# EAGLE design pcb_kamex_fuentes_5v_7amp_1.3 (EAGLE 7.6.0)
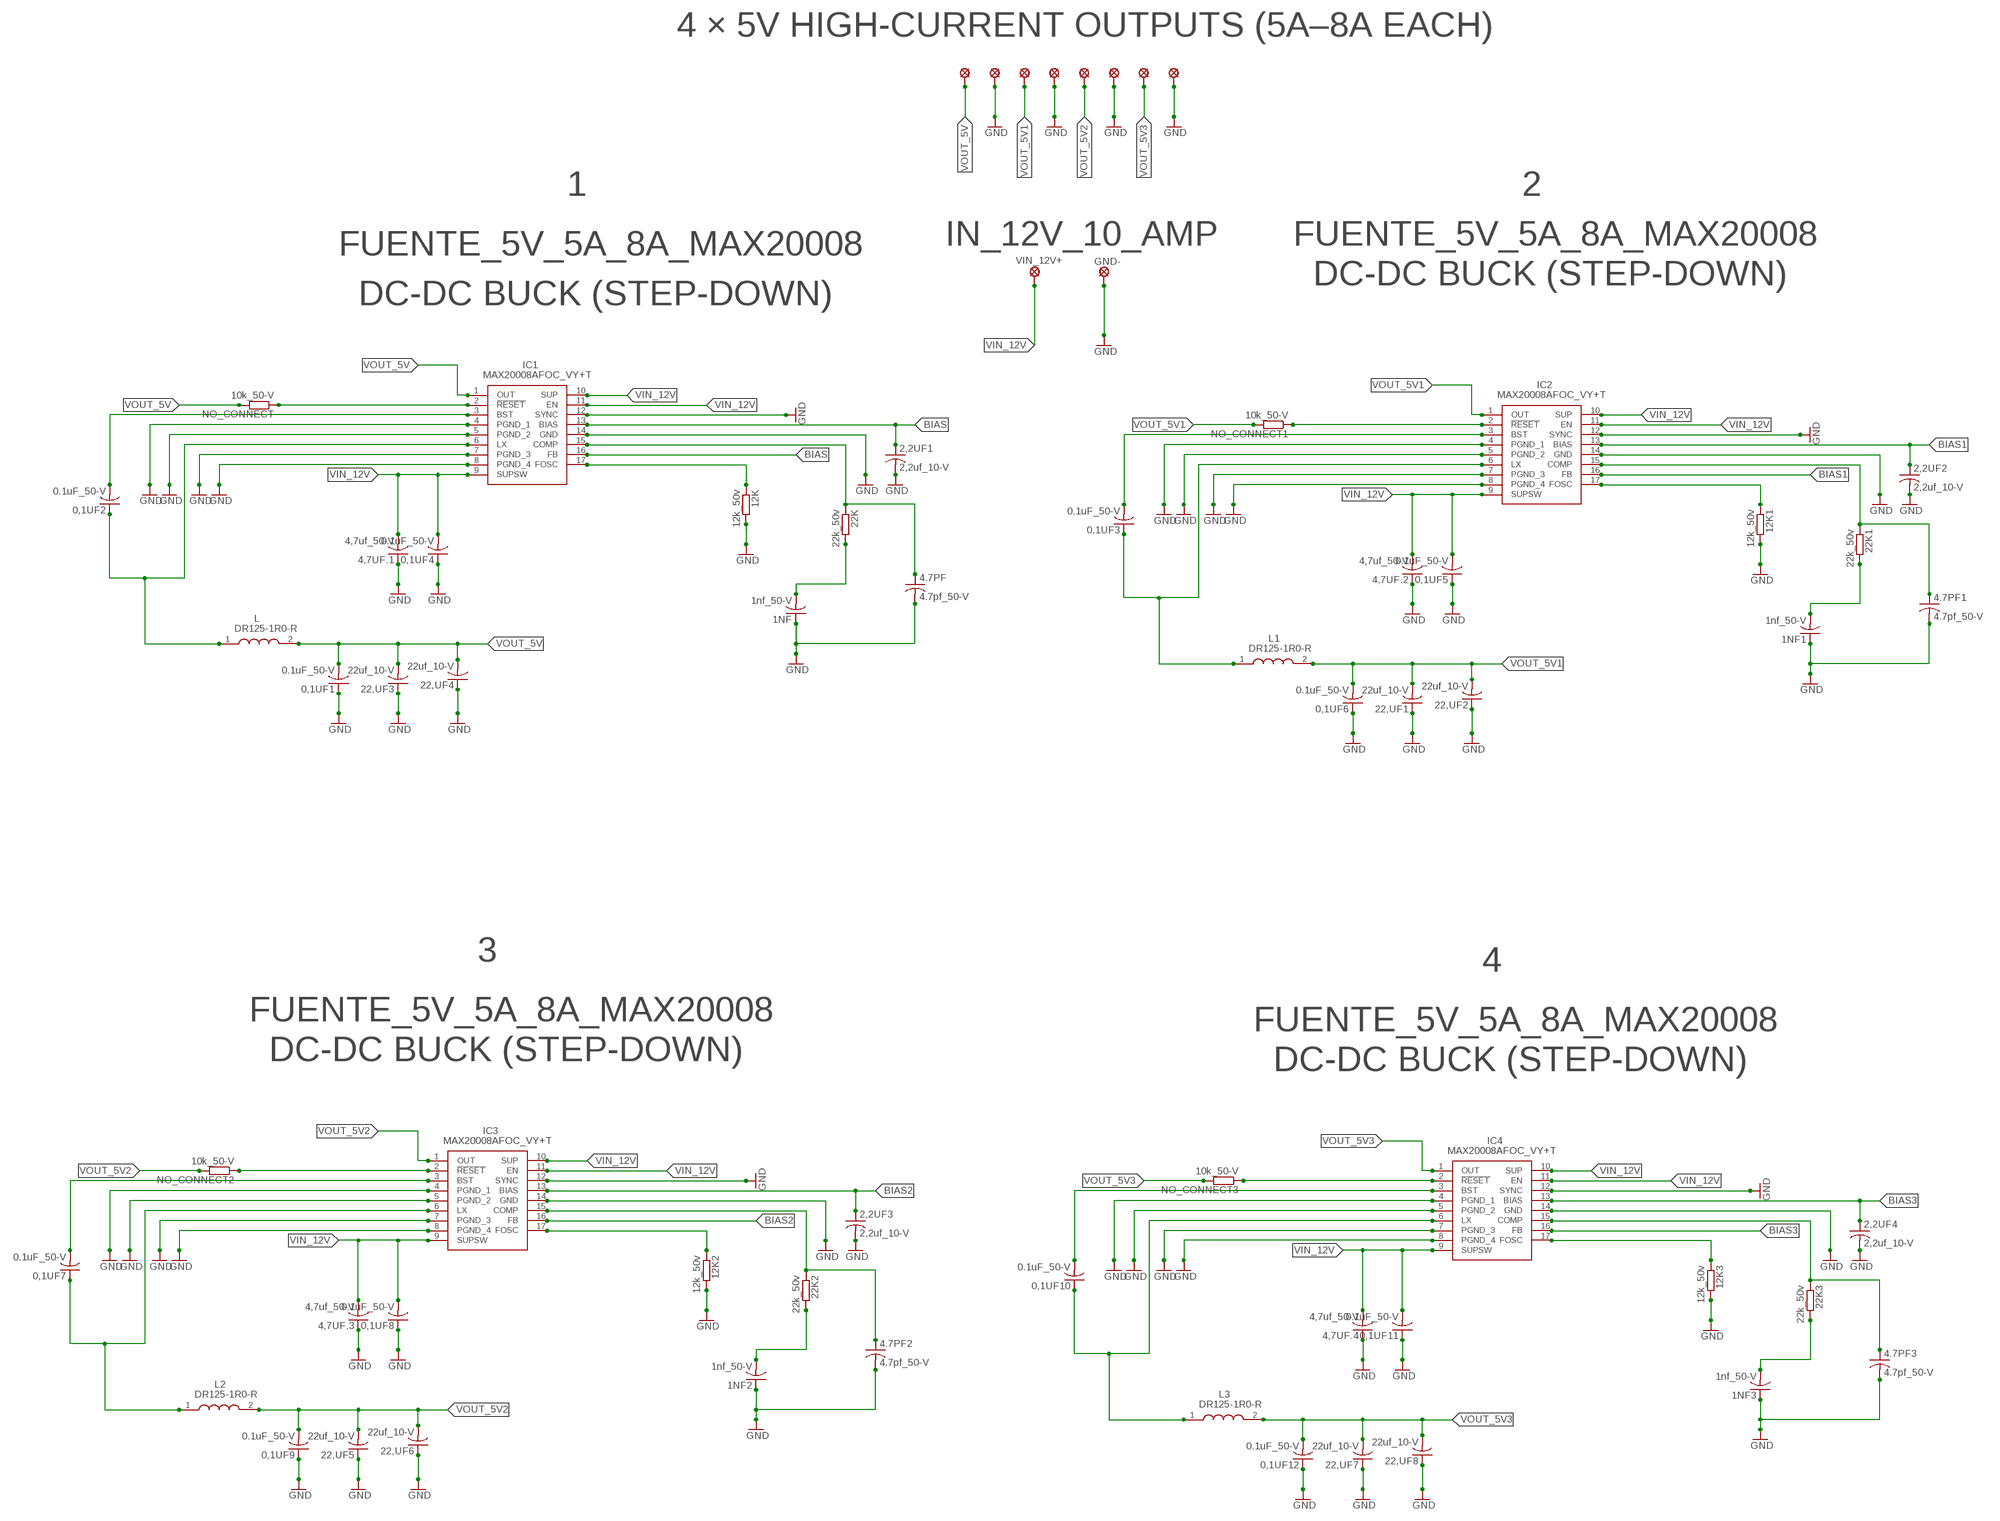
[diagram p0: schematic, sheet 1]

## Parts
0,1UF1  0.1uF_50-V  C-USC0805  [C0805]
0,1UF2  0.1uF_50-V  C-USC0805  [C0805]
0,1UF3  0.1uF_50-V  C-USC0805  [C0805]
0,1UF4  0.1uF_50-V  C-USC0805  [C0805]
0,1UF5  0.1uF_50-V  C-USC0805  [C0805]
0,1UF6  0.1uF_50-V  C-USC0805  [C0805]
0,1UF7  0.1uF_50-V  C-USC0805  [C0805]
0,1UF8  0.1uF_50-V  C-USC0805  [C0805]
0,1UF9  0.1uF_50-V  C-USC0805  [C0805]
0,1UF10  0.1uF_50-V  C-USC0805  [C0805]
0,1UF11  0.1uF_50-V  C-USC0805  [C0805]
0,1UF12  0.1uF_50-V  C-USC0805  [C0805]
1NF  1nf_50-V  C-USC0805  [C0805]
1NF1  1nf_50-V  C-USC0805  [C0805]
1NF2  1nf_50-V  C-USC0805  [C0805]
1NF3  1nf_50-V  C-USC0805  [C0805]
2,2UF1  2,2uf_10-V  C-USC0805  [C0805]
2,2UF2  2,2uf_10-V  C-USC0805  [C0805]
2,2UF3  2,2uf_10-V  C-USC0805  [C0805]
2,2UF4  2,2uf_10-V  C-USC0805  [C0805]
4,7UF.1  4,7uf_50-V  C-USC0805  [C0805]
4,7UF.2  4,7uf_50-V  C-USC0805  [C0805]
4,7UF.3  4,7uf_50-V  C-USC0805  [C0805]
4,7UF.4  4,7uf_50-V  C-USC0805  [C0805]
4.7PF  4.7pf_50-V  C-USC0805  [C0805]
4.7PF1  4.7pf_50-V  C-USC0805  [C0805]
4.7PF2  4.7pf_50-V  C-USC0805  [C0805]
4.7PF3  4.7pf_50-V  C-USC0805  [C0805]
12K  12k_50v  R-EU_M0805  [M0805]
12K1  12k_50v  R-EU_M0805  [M0805]
12K2  12k_50v  R-EU_M0805  [M0805]
12K3  12k_50v  R-EU_M0805  [M0805]
22,UF1  22uf_10-V  C-USC0805  [C0805]
22,UF2  22uf_10-V  C-USC0805  [C0805]
22,UF3  22uf_10-V  C-USC0805  [C0805]
22,UF4  22uf_10-V  C-USC0805  [C0805]
22,UF5  22uf_10-V  C-USC0805  [C0805]
22,UF6  22uf_10-V  C-USC0805  [C0805]
22,UF7  22uf_10-V  C-USC0805  [C0805]
22,UF8  22uf_10-V  C-USC0805  [C0805]
22K  22k_50v  R-EU_M0805  [M0805]
22K1  22k_50v  R-EU_M0805  [M0805]
22K2  22k_50v  R-EU_M0805  [M0805]
22K3  22k_50v  R-EU_M0805  [M0805]
GND  SE13  [SE13]
GND-  SE14  [SE14]
IC1  MAX20008AFOC_VY+T  [MAX20008AFOCVYT]
IC2  MAX20008AFOC_VY+T  [MAX20008AFOCVYT]
IC3  MAX20008AFOC_VY+T  [MAX20008AFOCVYT]
IC4  MAX20008AFOC_VY+T  [MAX20008AFOCVYT]
L  DR125-1R0-R  [INDPM125125X600N]
L1  DR125-1R0-R  [INDPM125125X600N]
L2  DR125-1R0-R  [INDPM125125X600N]
L3  DR125-1R0-R  [INDPM125125X600N]
LSP6  SE13  [SE13]
LSP7  SE13  [SE13]
LSP8  SE13  [SE13]
LSP9  SE13  [SE13]
LSP10  SE13  [SE13]
NO_CONNECT  10k_50-V  R-EU_M0805  [M0805]
NO_CONNECT1  10k_50-V  R-EU_M0805  [M0805]
NO_CONNECT2  10k_50-V  R-EU_M0805  [M0805]
NO_CONNECT3  10k_50-V  R-EU_M0805  [M0805]
VIN_12V+  SE14  [SE14]
VOUT_5V  SE13  [SE13]
VOUT_5V3  SE13  [SE13]

## Nets
BIAS: 2,2UF1.1 IC1.13(BIAS) IC1.16(FB)
BIAS1: 2,2UF2.1 IC2.13(BIAS) IC2.16(FB)
BIAS2: 2,2UF3.1 IC3.13(BIAS) IC3.16(FB)
BIAS3: 2,2UF4.1 IC4.13(BIAS) IC4.16(FB)
BST: 0,1UF2.2 IC1.3(BST)
BST1: 0,1UF3.2 IC2.3(BST)
BST2: 0,1UF7.2 IC3.3(BST)
BST3: 0,1UF10.2 IC4.3(BST)
COM: 4.7PF.1 22K.1 IC1.15(COMP)
COM1: 4.7PF1.1 22K1.1 IC2.15(COMP)
COM2: 4.7PF2.1 22K2.1 IC3.15(COMP)
COM3: 4.7PF3.1 22K3.1 IC4.15(COMP)
GND [power]: 0,1UF1.1 0,1UF4.1 0,1UF5.1 0,1UF6.1 0,1UF8.1 0,1UF9.1 0,1UF11.1 0,1UF12.1 1NF1.1 1NF2.1 1NF3.1 1NF.1 2,2UF1.2 2,2UF2.2 2,2UF3.2 2,2UF4.2 4,7UF.1.1 4,7UF.2.1 4,7UF.3.1 4,7UF.4.1 4.7PF1.2 4.7PF2.2 4.7PF3.2 4.7PF.2 12K1.2 12K2.2 12K3.2 12K.2 22,UF1.1 22,UF2.1 22,UF3.1 22,UF4.1 22,UF5.1 22,UF6.1 22,UF7.1 22,UF8.1 GND-.MP GND.MP IC1.4(PGND_1) IC1.5(PGND_2) IC1.7(PGND_3) IC1.8(PGND_4) IC1.12(SYNC) IC1.14(GND) IC2.4(PGND_1) IC2.5(PGND_2) IC2.7(PGND_3) IC2.8(PGND_4) IC2.12(SYNC) IC2.14(GND) IC3.4(PGND_1) IC3.5(PGND_2) IC3.7(PGND_3) IC3.8(PGND_4) IC3.12(SYNC) IC3.14(GND) IC4.4(PGND_1) IC4.5(PGND_2) IC4.7(PGND_3) IC4.8(PGND_4) IC4.12(SYNC) IC4.14(GND) LSP6.MP LSP8.MP LSP10.MP
N$1: 12K1.1 IC2.17(FOSC)
N$2: 1NF.2 22K.2
N$4: 0,1UF3.1 IC2.6(LX) L1.1
N$5: IC2.2(!RESET) NO_CONNECT1.1
N$6: 1NF1.2 22K1.2
N$7: 12K.1 IC1.17(FOSC)
N$9: 12K2.1 IC3.17(FOSC)
N$10: 0,1UF7.1 IC3.6(LX) L2.1
N$11: 0,1UF2.1 IC1.6(LX) L.1
N$12: IC1.2(!RESET) NO_CONNECT.1
N$13: IC3.2(!RESET) NO_CONNECT2.1
N$14: 1NF2.2 22K2.2
N$16: 12K3.1 IC4.17(FOSC)
N$17: 0,1UF10.1 IC4.6(LX) L3.1
N$18: IC4.2(!RESET) NO_CONNECT3.1
N$19: 1NF3.2 22K3.2
VIN_12V [power]: 0,1UF4.2 0,1UF5.2 0,1UF8.2 0,1UF11.2 4,7UF.1.2 4,7UF.2.2 4,7UF.3.2 4,7UF.4.2 IC1.9(SUPSW) IC1.10(SUP) IC1.11(EN) IC2.9(SUPSW) IC2.10(SUP) IC2.11(EN) IC3.9(SUPSW) IC3.10(SUP) IC3.11(EN) IC4.9(SUPSW) IC4.10(SUP) IC4.11(EN) VIN_12V+.MP
VOUT_5V: 0,1UF1.2 22,UF3.2 22,UF4.2 IC1.1(OUT) L.2 NO_CONNECT.2 VOUT_5V.MP
VOUT_5V1: 0,1UF6.2 22,UF1.2 22,UF2.2 IC2.1(OUT) L1.2 LSP7.MP NO_CONNECT1.2
VOUT_5V2: 0,1UF9.2 22,UF5.2 22,UF6.2 IC3.1(OUT) L2.2 LSP9.MP NO_CONNECT2.2
VOUT_5V3: 0,1UF12.2 22,UF7.2 22,UF8.2 IC4.1(OUT) L3.2 NO_CONNECT3.2 VOUT_5V3.MP

## Notes on the sheet
- 4 × 5V HIGH-CURRENT OUTPUTS (5A–8A EACH)
- 1 | 2
- FUENTE_5V_5A_8A_MAX20008 | IN_12V_10_AMP | FUENTE_5V_5A_8A_MAX20008
- DC-DC BUCK (STEP-DOWN)
- DC-DC BUCK (STEP-DOWN)
- 3 | 4
- FUENTE_5V_5A_8A_MAX20008 | FUENTE_5V_5A_8A_MAX20008
- DC-DC BUCK (STEP-DOWN) | DC-DC BUCK (STEP-DOWN)

## Library data of the parts
0,1UF1-0,1UF12 1NF 1NF1-1NF3 2,2UF1-2,2UF4 4,7UF.1-4,7UF.4 4.7PF 4.7PF1-4.7PF3 22,UF1-22,UF8 = rcl:C-US: CAPACITOR, American symbol
12K 12K1-12K3 22K 22K1-22K3 NO_CONNECT NO_CONNECT1-NO_CONNECT3 = rcl_dani:R-EU_: RESISTOR, European symbol
GND LSP6-LSP10 VOUT_5V VOUT_5V3 = solpad:SE13: SOLDER PAD E1542, drill 1,3mm, distributor Buerklin, 07F815
GND- VIN_12V+ = solpad:SE14: SOLDER PAD E1553, drill 1,4mm, distributor Buerklin, 07F820
IC1-IC4 = MAX20008AFOC_VY+T:MAX20008AFOC_VY+T: Switching Voltage Regulators 36V, 220kHz to 2.2MHz, 4A/6A/8A Fully integrated step down converter Source: Datasheet <https://componentsearchengine.com//MAX20008AFOC_VY T.pdf>; DESCRIPTION: Switching Voltage Regulators 36V, 220kHz to 2.2MHz, 4A/6A/8A Fully integrated step down converter; HEIGHT: 0.75mm; MANUFACTURER_NAME: Analog Devices; MANUFACTURER_PART_NUMBER: MAX20008AFOC/VY+T; MOUSER_PART_NUMBER: 700-MAX20008AFOC/VYT; MOUSER_PRICE-STOCK: https://www.mouser.co.uk/ProductDetail/Analog-Devices-Maxim-Integrated/MAX20008AFOC-VY%2bT?qs=vLWxofP3U2wvQQR8GkDmgw%3D%3D
L L1-L3 = DR125-1R0-R:DR125-1R0-R: Inductor Power Shielded Drum Core 0.894uH/1uH 20% 100KHz Ferrite 15A 0.0024Ohm DCR T/R Source: Datasheet <https://www.eaton.com/content/dam/eaton/products/electronic-components/resources/data-sheet/eaton-dr-high-power-density-high-efficiency-shielded-drum-core-power-inductors-data-sheet.pdf>; DESCRIPTION: Inductor Power Shielded Drum Core 0.894uH/1uH 20% 100KHz Ferrite 15A 0.0024Ohm DCR T/R; HEIGHT: 6mm; MANUFACTURER_NAME: Eaton; MANUFACTURER_PART_NUMBER: DR125-1R0-R

## Net classes
0 default: width 0.381 mm, drill 0.01 mm, clearance 0.254 mm
1 power: width 1.27 mm, drill 0.762 mm, clearance 0.254 mm
2 thin: width 0.254 mm, drill 0.254 mm, clearance 0.254 mm

## Board
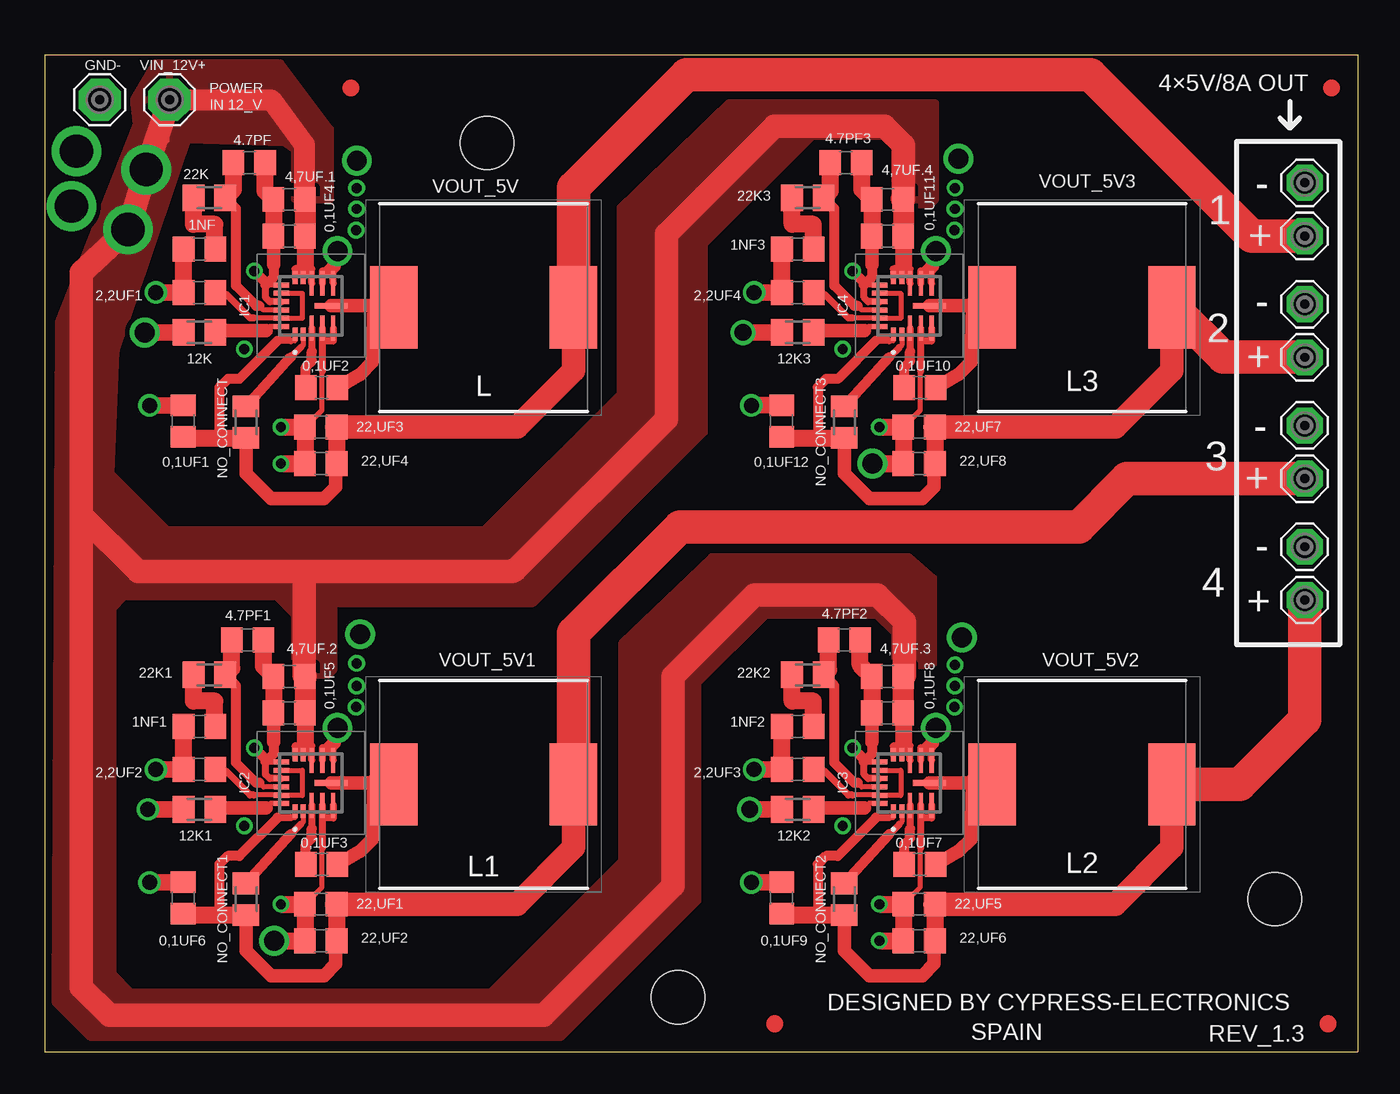
[diagram p1: board, top side]
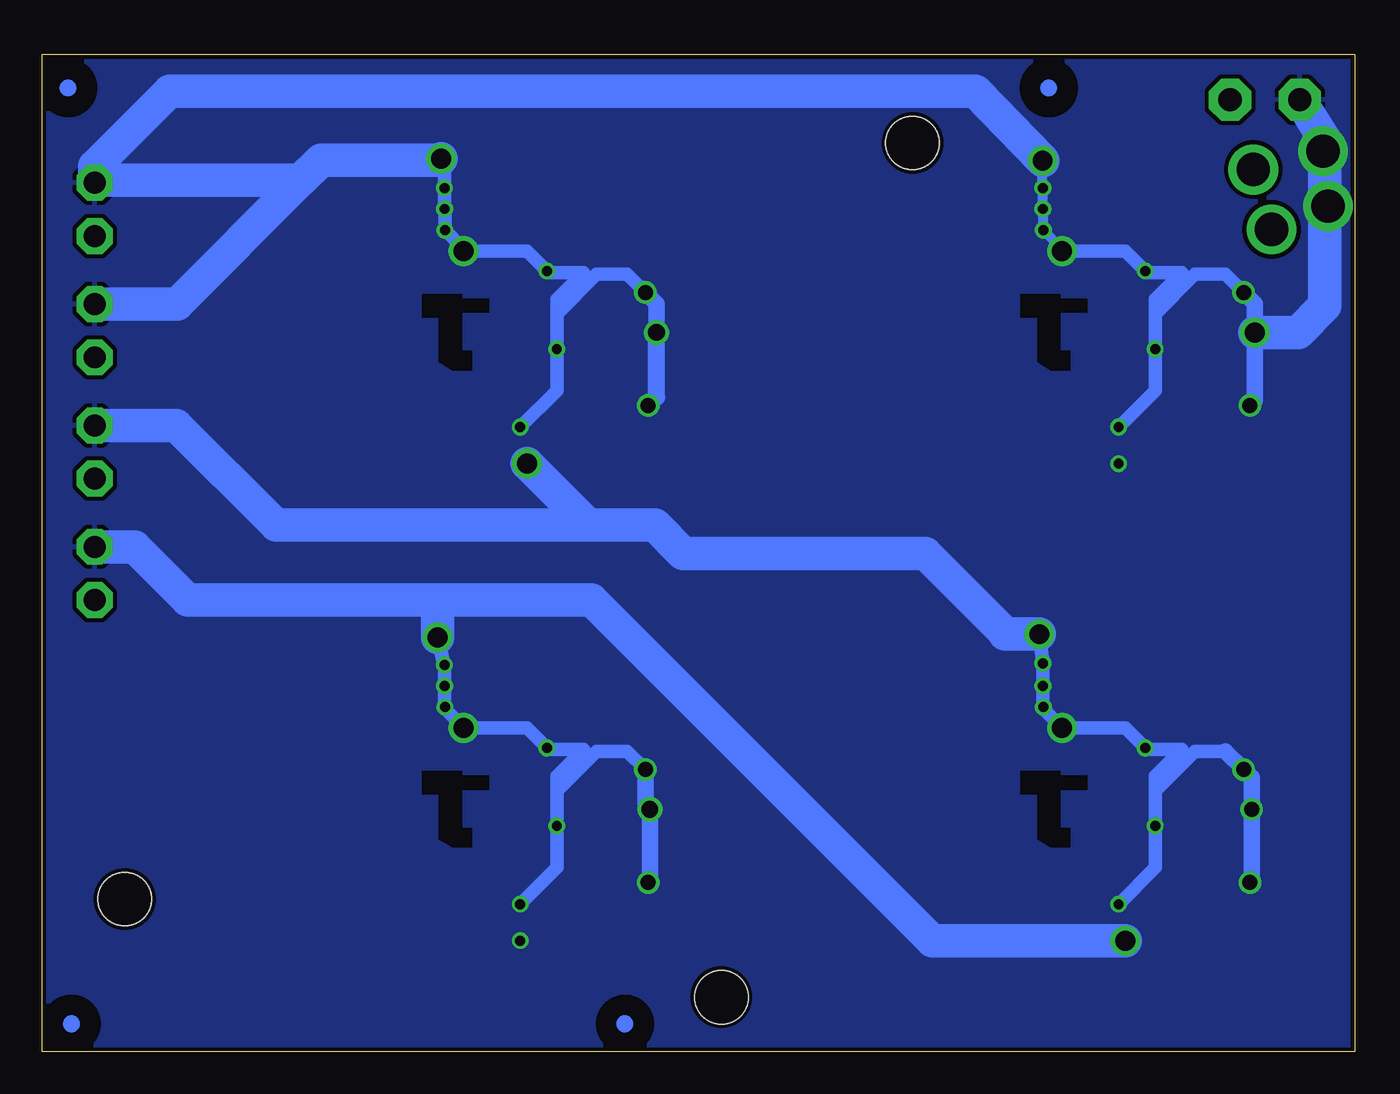
[diagram p2: board, bottom side, seen from below]

Size 79 x 60 mm. Coordinates in mm from the lower left corner, seen from the top.
Outline: 0,0 79,0 79,60 0,60 0,0
Copper layers (1*16): Top 0.035mm / dielectric 1.5mm / Bottom 0.035mm
Design rules "default *": minimum track width 10mil, minimum drill 24mil, track to track 8mil, track to pad 8mil, pad to pad 8mil, via to via 8mil, smd to smd 8mil, copper to edge 10mil, drill to drill 8mil, minimum pad ring 10mil, minimum via ring 8mil, stop-mask expansion 4mil, vias tented up to drill 0mil, thermal gap 10mil
Holes 3.2 mm at 26.6,54.7 38.1,3.3 74,9.2

### Footprints (pad centres in the part's own frame; a part is rotated, then mirrored left to right if it is on the bottom)
C0805 = smd 1.3 x 1.5: 1 -0.95,0; 2 0.95,0
M0805 = smd 1.3 x 1.6: 1 -0.95,0; 2 0.95,0
SE13 = drill 1.321 pad 2.159 octagon: MP 0,0
SE14 = drill 1.397 pad 2.54 octagon: MP 0,0
MAX20008AFOCVYT = smd 0.8 x 0.3: 1 -1.7,0.948; 2 -1.7,0.45; 10 1.7,0.45; 11 1.7,0.948 | smd 1.5 x 0.25: 3 -1.35,-0.05; 4 -1.35,-0.7; 5 -1.35,-1.35; 7 1.35,-1.35; 8 1.35,-0.7; 9 1.35,-0.05 | smd 0.35 x 2: 6 0,-1.225 | smd 0.3 x 0.925: 12 1.25,1.763; 13 0.75,1.763; 14 0.25,1.763; 15 -0.25,1.763; 16 -0.75,1.763; 17 -1.25,1.763
INDPM125125X600N = smd 2.85 x 4.95: 1 -5.4,0; 2 5.4,0

### Placement (x,y rotation side)
0,1UF1  8.33,37.97 270 top
0,1UF2  16.65,39.98 180 top
0,1UF3  16.65,11.28 180 top
0,1UF4  14.7,49.1 0 top
0,1UF5  14.7,20.4 0 top
0,1UF6  8.33,9.27 270 top
0,1UF7  52.65,11.28 180 top
0,1UF8  50.7,20.4 0 top
0,1UF9  44.33,9.27 270 top
0,1UF10  52.65,39.98 180 top
0,1UF11  50.7,49.1 0 top
0,1UF12  44.33,37.97 270 top
1NF  9.3,48.3 0 top
1NF1  9.3,19.6 0 top
1NF2  45.3,19.6 0 top
1NF3  45.3,48.3 0 top
2,2UF1  9.3,45.7 180 top
2,2UF2  9.3,17 180 top
2,2UF3  45.3,17 180 top
2,2UF4  45.3,45.7 180 top
4,7UF.1  14.7,51.3 0 top
4,7UF.2  14.7,22.6 0 top
4,7UF.3  50.7,22.6 0 top
4,7UF.4  50.7,51.3 0 top
4.7PF  12.3,53.5 0 top
4.7PF1  12.2,24.8 0 top
4.7PF2  48.1,24.8 0 top
4.7PF3  48.2,53.5 0 top
12K  9.3,43.3 180 top
12K1  9.3,14.6 180 top
12K2  45.3,14.6 180 top
12K3  45.3,43.3 180 top
22,UF1  16.6,8.9 0 top
22,UF2  16.6,6.7 0 top
22,UF3  16.6,37.6 0 top
22,UF4  16.6,35.4 0 top
22,UF5  52.6,8.9 0 top
22,UF6  52.6,6.7 0 top
22,UF7  52.6,37.6 0 top
22,UF8  52.6,35.4 0 top
22K  9.9,51.4 180 top
22K1  9.9,22.7 180 top
22K2  45.9,22.7 180 top
22K3  45.9,51.4 180 top
GND  75.8,52.3 0 top
GND-  3.3,57.3 0 top
IC1  16,44.9 90 top
IC2  16,16.2 90 top
IC3  52,16.2 90 top
IC4  52,44.9 90 top
L  26.4,44.8 0 top
L1  26.4,16.1 0 top
L2  62.4,16.1 0 top
L3  62.4,44.8 0 top
LSP6  75.8,45 0 top
LSP7  75.8,34.5 0 top
LSP8  75.8,37.7 0 top
LSP9  75.8,27.2 0 top
LSP10  75.8,30.4 0 top
NO_CONNECT  12.1,37.9 270 top
NO_CONNECT1  12.1,9.2 270 top
NO_CONNECT2  48.1,9.2 270 top
NO_CONNECT3  48.1,37.9 270 top
U$4  [CIRCLE-1MM-3R]  18.4,58 0 top
U$5  [CIRCLE-1MM-3R]  77.4,58 0 top
U$6  [CIRCLE-1MM-3R]  77.2,1.7 0 top
U$7  [CIRCLE-1MM-3R]  43.9,1.7 0 top
VIN_12V+  7.5,57.3 0 top
VOUT_5V  75.8,49.1 0 top
VOUT_5V3  75.8,41.8 0 top

### Tracks (layer width: path | path; a pad name or v marks a point on that pad's centre or on a via)
BIAS
  Top 0.305: IC1.13 15.49,45.65 15.49,44.14 IC1.16 14.23,44.16 12.59,44.16 | 2,2UF1.1 10.3,45.7
  Top 0.406: 12.59,44.16 12.34,44.16 10.9,45.6 10.35,45.6 2,2UF1.1
BIAS1
  Top 0.305: IC2.13 15.49,16.95 15.49,15.44 IC2.16 14.23,15.46 12.59,15.46 | 2,2UF2.1 10.3,17
  Top 0.406: 12.59,15.46 12.34,15.46 10.9,16.9 10.35,16.9 2,2UF2.1
BIAS2
  Top 0.305: IC3.13 51.49,16.95 51.49,15.44 IC3.16 50.23,15.46 48.59,15.46 | 2,2UF3.1 46.3,17
  Top 0.406: 48.59,15.46 48.34,15.46 46.9,16.9 46.35,16.9 2,2UF3.1
BIAS3
  Top 0.305: IC4.13 51.49,45.65 51.49,44.14 IC4.16 50.23,44.16 48.59,44.16 | 2,2UF4.1 46.3,45.7
  Top 0.406: 48.59,44.16 48.34,44.16 46.9,45.6 46.35,45.6 2,2UF4.1
BST
  Top 0.406: IC1.3 16.05,42.15
  Top 0.61: 0,1UF2.2 15.7,41.2 16,41.5 16,41.52 16.06,41.58 16.06,42.14 16.05,42.15
BST1
  Top 0.406: IC2.3 16.05,13.45
  Top 0.61: 0,1UF3.2 15.7,12.5 16,12.8 16,12.82 16.06,12.88 16.06,13.44 16.05,13.45
BST2
  Top 0.406: IC3.3 52.05,13.45
  Top 0.61: 0,1UF7.2 51.7,12.5 52,12.8 52,12.82 52.06,12.88 52.06,13.44 52.05,13.45
BST3
  Top 0.406: IC4.3 52.05,42.15
  Top 0.61: 0,1UF10.2 51.7,41.2 52,41.5 52,41.52 52.06,41.58 52.06,42.14 52.05,42.15
COM
  Top 0.305: IC1.15 13.15,44.65 12.9,44.9
  Top 0.61: 12.9,44.9 12.7,44.9 11.5,46.1 11.5,50.75 22K.1
  Top 1.016: 22K.1 11.35,51.9 4.7PF.1
COM1
  Top 0.305: IC2.15 13.15,15.95 12.9,16.2
  Top 0.61: 12.9,16.2 12.7,16.2 11.5,17.4 11.5,22.05 22K1.1
  Top 1.016: 22K1.1 11.25,23.1 4.7PF1.1
COM2
  Top 0.305: IC3.15 49.15,15.95 48.9,16.2
  Top 0.61: 48.9,16.2 48.7,16.2 47.5,17.4 47.5,22.05 22K2.1
  Top 1.016: 22K2.1 47.15,23 4.7PF2.1
COM3
  Top 0.305: IC4.15 49.15,44.65 48.9,44.9
  Top 0.61: 48.9,44.9 48.7,44.9 47.5,46.1 47.5,50.75 22K3.1
  Top 1.016: 22K3.1 47.25,51.8 4.7PF3.1
GND  (via drill 0.6, 0.9, 1, 1.2, 2)
  Top 0.305: 16.7,40.96 16.66,40.92 16.66,38.61 22,UF3.1 | IC1.12 14.23,46.16 13.28,46.16 13.27,46.17 | 16.7,12.26 16.66,12.22 16.66,9.91 22,UF1.1 | IC2.12 14.23,17.46 13.28,17.46 13.27,17.47 | 52.7,12.26 52.66,12.22 52.66,9.91 22,UF5.1 | IC3.12 50.23,17.46 49.28,17.46 49.27,17.47 | 52.7,40.96 52.66,40.92 52.66,38.61 22,UF7.1 | IC4.12 50.23,46.16 49.28,46.16 49.27,46.17
  Top 0.406: IC1.7 17.35,47 | 17.35,47 17.1,47 16.7,47 IC1.8 | IC1.5 17.35,42.78 17.36,42.78 17.36,42.79 16.7,42.79 | 16.7,42.79 IC1.4 | 17.35,47 17.4,47 | IC1.14 13.53,45.15 13.28,45.4 13.28,46.16 | 16.7,40.96 16.7,42.79 | IC2.7 17.35,18.3 | 17.35,18.3 17.1,18.3 16.7,18.3 IC2.8 | IC2.5 17.35,14.08 17.36,14.08 17.36,14.09 16.7,14.09 | 16.7,14.09 IC2.4 | 17.35,18.3 17.4,18.3 | IC2.14 13.53,16.45 13.28,16.7 13.28,17.46 | 16.7,12.26 16.7,14.09 | IC3.7 53.35,18.3 | 53.35,18.3 53.1,18.3 52.7,18.3 IC3.8 | IC3.5 53.35,14.08 53.36,14.08 53.36,14.09 52.7,14.09 | 52.7,14.09 IC3.4 | 53.35,18.3 53.4,18.3 | IC3.14 49.53,16.45 49.28,16.7 49.28,17.46 | 52.7,12.26 52.7,14.09 | IC4.7 53.35,47 | 53.35,47 53.1,47 52.7,47 IC4.8 | IC4.5 53.35,42.78 53.36,42.78 53.36,42.79 52.7,42.79 | 52.7,42.79 IC4.4 | 53.35,47 53.4,47 | IC4.14 49.53,45.15 49.28,45.4 49.28,46.16 | 52.7,40.96 52.7,42.79
  Top 0.61: 13.75,47.37 13.75,46.63 13.28,46.16 | 13.27,46.17 13.27,46.33 v12.6,47 | 13.75,18.67 13.75,17.93 13.28,17.46 | 13.27,17.47 13.27,17.63 v12.6,18.3 | 49.75,18.67 49.75,17.93 49.28,17.46 | 49.27,17.47 49.27,17.63 v48.6,18.3 | 49.75,47.37 49.75,46.63 49.28,46.16 | 49.27,46.17 49.27,46.33 v48.6,47
  Top 0.813: 0,1UF4.1 13.75,47.37 | 17.1,47 17.4,47.3 17.4,48 v17.6,48.2 | 0,1UF5.1 13.75,18.67 | 17.1,18.3 17.4,18.6 17.4,19.3 v17.6,19.5 | 0,1UF8.1 49.75,18.67 | 53.1,18.3 53.4,18.6 53.4,19.3 v53.6,19.5 | 0,1UF11.1 49.75,47.37 | 53.1,47 53.4,47.3 53.4,48 v53.6,48.2
  Top 1: v42.5,10.2 44.31,10.2 0,1UF9.1 | 12K2.2 v42.4,14.6 | 2,2UF3.2 v42.67,17 | 0,1UF12.1 42.52,38.92 v42.5,38.9 | 12K3.2 v42,43.3 | 2,2UF4.2 v42.67,45.7 | 0,1UF1.1 8.31,38.9 v6.3,38.9 | 12K.2 v6,43.3 | 2,2UF1.2 v6.67,45.7 | 0,1UF6.1 8.31,10.2 v6.3,10.2 | 12K1.2 v6.2,14.6 | 2,2UF2.2 v6.67,17
  Top 1.016: 0,1UF4.1 4,7UF.1.1 13.25,51.8 4.7PF.2 | 2,2UF1.2 1NF.1 | v14.2,37.6 22,UF3.1 22,UF4.1 v14.2,35.4 | 8.35,38.94 0,1UF1.1 | 0,1UF5.1 4,7UF.2.1 13.15,23.2 4.7PF1.2 | 2,2UF2.2 1NF1.1 | v14.2,8.9 22,UF1.1 22,UF2.1 v13.8,6.7 | 8.35,10.24 0,1UF6.1 | 0,1UF8.1 4,7UF.3.1 49.05,23.3 4.7PF2.2 | 2,2UF3.2 1NF2.1 | v50.2,8.9 22,UF5.1 22,UF6.1 v50.2,6.7 | 44.35,10.24 0,1UF9.1 | 0,1UF11.1 4,7UF.4.1 49.15,51.9 4.7PF3.2 | 2,2UF4.2 1NF3.1 | v50.2,37.6 22,UF7.1 22,UF8.1 v49.8,35.4 | 44.35,38.94 0,1UF12.1
  Bottom 0.61: v18.77,53.64 18.8,53.21 18.8,51.9 18.76,51.94 v18.76,51.99 v18.75,51.98 v18.75,50.73 18.73,50.71 v18.73,49.45 17.6,48.32 v17.6,48.2
  Bottom 0.813: v17.6,48.2 13.8,48.2 v12.6,47 12.5,46.9 10.4,46.9 12,45.3 12,44.4 | 12,44.4 v12,42.3 12,39.8 v14.2,37.6 | 12,44.4 9.6,46.8 7.77,46.8 v6.67,45.7 | 12,15.7 v12,13.6 12,11.1 v14.2,8.9 | 12,15.7 9.6,18.1 7.77,18.1 | 12,15.7 12,16.6 10.4,18.2 12.5,18.2 v12.6,18.3 13.8,19.5 v17.6,19.5 18.73,20.63 v18.73,20.75 18.75,20.77 v18.75,22.03 v18.76,22.04 v18.76,23.39 v18.77,23.4 v18.97,25.14 | 48,15.7 v48,13.6 48,11.1 v50.2,8.9 | 48,15.7 45.6,18.1 43.77,18.1 v42.67,17 | 48,15.7 48,16.6 46.4,18.2 48.5,18.2 v48.6,18.3 49.8,19.5 v53.6,19.5 54.73,20.63 v54.73,20.75 54.76,20.78 v54.76,22.04 | 48,44.4 v48,42.3 48,39.8 v50.2,37.6 | 48,44.4 45.6,46.8 43.77,46.8 v42.67,45.7 | 48,44.4 48,45.3 46.4,46.9 48.5,46.9 v48.6,47 49.8,48.2 v53.6,48.2 53.6,48.32 v54.73,49.45 54.73,50.71 v54.75,50.73 v54.75,51.98 v54.76,51.99 54.76,53.53 v54.97,53.74 | v54.76,22.04 v54.76,23.29 v54.77,23.3 v55.17,24.94 | v54.76,22.04 v54.75,22.03
  Bottom 1: v42.5,10.2 42.4,10.3 v42.4,14.6 42.67,14.87 v42.67,17 | v42,43.3 42,45.03 v42.67,45.7 | v6.67,45.7 6,45.03 v6,43.3 6,39.2 v6.3,38.9 | v6.3,10.2 6.2,10.3 v6.2,14.6 6.2,16.53 v6.67,17 7.77,18.1
  Bottom 1.016: v42.5,38.9 42,39.4 v42,43.3
  Bottom 1.422: 66.1,52.3 65.95,52.45
  Bottom 2: GND-.MP 1.8,54.9 1.8,44.9 3.4,43.3 v6,43.3 | v18.77,53.64 22.83,57.8 71.3,57.8 75.8,53.3 GND.MP arc90 75.65,52.45 65.95,52.45 63.4,52.45 | LSP6.MP 70.85,45 63.4,52.45 | 63.4,52.45 62.18,53.67 55.04,53.67 v54.97,53.74 | v55.17,24.94 55.17,27.17 | 55.17,27.17 55.2,27.2 70.2,27.2 73.4,30.4 LSP10.MP | v13.8,6.7 25.4,6.7 45.9,27.2 55.14,27.2 55.17,27.17 | v18.97,25.14 21.04,25.14 21.04,25.21 25.83,30 40.4,30 42.1,31.7 46.1,31.7 | 46.1,31.7 64.9,31.7 70.9,37.7 LSP8.MP | 46.1,31.7 v49.8,35.4
  other vias: 1.9,54.2 1.6,50.9
  cutout Bottom: 20.1,45.6 17.69,45.6 17.69,45.34 16.09,45.34 16.09,44.48 17.7,44.48 17.7,42.2 17.1,42.2 17.1,41 18.3,41 18.6,41.2 18.69,41.25 18.76,41.29 19.1,41.5 19.1,44.2 20.1,44.2
  cutout Bottom: 20.1,16.9 17.69,16.9 17.69,16.64 16.09,16.64 16.09,15.78 17.7,15.78 17.7,13.5 17.1,13.5 17.1,12.3 18.3,12.3 18.6,12.5 18.69,12.55 18.76,12.59 19.1,12.8 19.1,15.5 20.1,15.5
  cutout Bottom: 56.1,16.9 53.69,16.9 53.69,16.64 52.09,16.64 52.09,15.78 53.7,15.78 53.7,13.5 53.1,13.5 53.1,12.3 54.3,12.3 54.6,12.5 54.69,12.55 54.76,12.59 55.1,12.8 55.1,15.5 56.1,15.5
  cutout Bottom: 56.1,45.6 53.69,45.6 53.69,45.34 52.09,45.34 52.09,44.48 53.7,44.48 53.7,42.2 53.1,42.2 53.1,41 54.3,41 54.6,41.2 54.69,41.25 54.76,41.29 55.1,41.5 55.1,44.2 56.1,44.2
  pour Bottom (isolate 0.254): -1,61.8 81,61.8 81,-1.7 -1,-1.7
N$1
  Top 0.305: 10.6,14.95 12K1.1 | IC2.17 13.55,14.95 13.3,14.7
  Top 0.813: 13.3,14.7 10.35,14.7 12K1.1
N$2
  Top 1.016: 1NF.2 10.23,48.3 10.23,49.81 8.95,49.81 22K.2
N$3
  cutout Top (isolate 0.2, rank 2): 16.09,45.34 16.09,44.48 17.7,44.48 17.7,42.2 17.1,42.2 17.1,41 18.3,41 19.1,41.5 19.1,44.2 19.4,44.2 19.4,42.1 22.7,42.1 22.7,47.5 19.4,47.5 19.4,45.6 17.68,45.6 17.68,45.34
N$4
  Top 0.813: IC2.6 19.8,16.2 19.7,12.8 19,12.1 0,1UF3.1
  Top 1.016: 19.8,16.2 20.9,16.2 L1.1
N$5
  Top 0.305: 12.52,10.57 NO_CONNECT1.1 | IC2.2 15.55,13.85 15.4,13.7
  Top 0.406: 15.4,13.7 14.8,13.1
  Top 0.61: 14.8,13.1 NO_CONNECT1.1
N$6
  Top 1.016: 1NF1.2 10.23,19.6 10.23,21.11 8.95,21.11 22K1.2
N$7
  Top 0.305: 10.6,43.65 12K.1 | IC1.17 13.55,43.65 13.3,43.4
  Top 0.813: 13.3,43.4 10.35,43.4 12K.1
N$8
  cutout Top (isolate 0.2, rank 2): 16.09,16.64 16.09,15.78 17.7,15.78 17.7,13.5 17.1,13.5 17.1,12.3 18.3,12.3 19.1,12.8 19.1,15.5 19.4,15.5 19.4,13.4 22.7,13.4 22.7,18.8 19.4,18.8 19.4,16.9 17.68,16.9 17.68,16.64
N$9
  Top 0.305: 46.6,14.95 12K2.1 | IC3.17 49.55,14.95 49.3,14.7
  Top 0.813: 49.3,14.7 46.35,14.7 12K2.1
N$10
  Top 0.813: IC3.6 55.8,16.2 55.7,12.8 55,12.1 0,1UF7.1
  Top 1.016: 55.8,16.2 56.9,16.2 L2.1
N$11
  Top 0.813: IC1.6 19.8,44.9 19.7,41.5 19,40.8 0,1UF2.1
  Top 1.016: 19.8,44.9 20.9,44.9 L.1
N$12
  Top 0.305: 12.52,39.27 NO_CONNECT.1 | IC1.2 15.55,42.55 15.4,42.4
  Top 0.406: 15.4,42.4 14.8,41.8
  Top 0.61: 14.8,41.8 NO_CONNECT.1
N$13
  Top 0.305: 48.52,10.57 NO_CONNECT2.1 | IC3.2 51.55,13.85 51.4,13.7
  Top 0.406: 51.4,13.7 50.8,13.1
  Top 0.61: 50.8,13.1 NO_CONNECT2.1
N$14
  Top 1.016: 1NF2.2 46.23,19.6 46.23,21.11 44.95,21.11 22K2.2
N$15
  cutout Top (isolate 0.2, rank 2): 52.09,16.64 52.09,15.78 53.7,15.78 53.7,13.5 53.1,13.5 53.1,12.3 54.3,12.3 55.1,12.8 55.1,15.5 55.4,15.5 55.4,13.4 58.7,13.4 58.7,18.8 55.4,18.8 55.4,16.9 53.68,16.9 53.68,16.64
N$16
  Top 0.305: 46.6,43.65 12K3.1 | IC4.17 49.55,43.65 49.3,43.4
  Top 0.813: 49.3,43.4 46.35,43.4 12K3.1
N$17
  Top 0.813: IC4.6 55.8,44.9 55.7,41.5 55,40.8 0,1UF10.1
  Top 1.016: 55.8,44.9 56.9,44.9 L3.1
N$18
  Top 0.305: 48.52,39.27 NO_CONNECT3.1 | IC4.2 51.55,42.55 51.4,42.4
  Top 0.406: 51.4,42.4 50.8,41.8
  Top 0.61: 50.8,41.8 NO_CONNECT3.1
N$19
  Top 1.016: 1NF3.2 46.23,48.3 46.23,49.81 44.95,49.81 22K3.2
N$20
  cutout Top (isolate 0.2, rank 2): 52.09,45.34 52.09,44.48 53.7,44.48 53.7,42.2 53.1,42.2 53.1,41 54.3,41 55.1,41.5 55.1,44.2 55.4,44.2 55.4,42.1 58.7,42.1 58.7,47.5 55.4,47.5 55.4,45.6 53.68,45.6 53.68,45.34
VIN_12V  (via drill 2)
  Top 0.2: VIN_12V+.MP 7.4,54.8
  Top 0.406: IC1.9 16.05,47.13 15.6,47.13 15.5,47.13 | 15.5,47.13 15.07,47.13 15.05,47.11 IC1.11 | IC1.10 15.55,47.08 15.5,47.13 | IC2.9 16.05,18.43 15.6,18.43 15.5,18.43 | 15.5,18.43 15.07,18.43 15.05,18.41 IC2.11 | IC2.10 15.55,18.38 15.5,18.43 | IC3.9 52.05,18.43 51.6,18.43 51.5,18.43 | 51.5,18.43 51.07,18.43 51.05,18.41 IC3.11 | IC3.10 51.55,18.38 51.5,18.43 | IC4.9 52.05,47.13 51.6,47.13 51.5,47.13 | 51.5,47.13 51.07,47.13 51.05,47.11 IC4.11 | IC4.10 51.55,47.08 51.5,47.13
  Top 1.016: 0,1UF4.2 15.65,47.18 15.6,47.13 | 0,1UF5.2 15.65,18.48 15.6,18.43 | 0,1UF8.2 51.65,18.48 51.6,18.43 | 0,1UF11.2 51.65,47.18 51.6,47.13
  Top 1.27: 0,1UF4.2 4,7UF.1.2 15.6,51.35 15.6,54.6 13.6,57.3 VIN_12V+.MP | 4,7UF.2.2 0,1UF5.2 | 4,7UF.4.2 0,1UF11.2 | 51.7,22.65 4,7UF.3.2 0,1UF8.2
  Top 1.422: 4,7UF.2.2 15.6,22.65 15.6,28.7 15.8,28.9 | 51.6,51.35 4,7UF.4.2 51.65,54.55 50.5,55.7 43.9,55.7 37.4,49.2 37.4,38.1 28.3,29 28.2,29 28.1,28.9 15.8,28.9 | 2.2,32.3 5.6,28.9 15.8,28.9 | 51.7,22.65 51.7,25.9 50.1,27.5 42.7,27.5 37.8,22.6 37.8,10 30,2.2 3.9,2.2 2.2,3.9 2.2,32.3 | 2.2,32.3 2.2,46.9 v5,49.5 v6.1,53.1 VIN_12V+.MP
  pour Top (isolate 0.254): 15,51.3 17.2,51.3 17.2,55.5 14.2,59.5 6.6,59.5 5.3,57.3 5.5,55.8 0.8,43.9 0.6,3 2.7,0.9 31.1,0.9 39.3,9.1 39.3,22.2 43.4,26.3 50,26.3 51.1,25.2 51.1,23.5 51.5,23.1 51.7,23 53.5,23.4 53.5,28.5 52,29.8 40.1,29.8 34.7,24.6 34.7,11.5 26.8,3.6 5.2,3.6 4.1,4.7 4.1,26.7 4.8,27.4 13.9,27.4 15,26.3 15,23 15.3,22.7 17.1,22.7 17.4,23 17.4,26.9 17.5,27 29.4,27 39.7,37.3 39.7,48.6 46.2,55.1 50.4,55.1 51.1,54.4 51.1,51.3 51.4,51 53.3,51 53.6,51.3 53.6,57.1 41.1,57.1 34.6,50.8 34.6,39.6 26.4,31.4 7.4,31.4 4,34.8 4.3,42.2 8.6,54.9 14.4,54.7 15,54.3
VOUT_5V
  Top 0.305: 22,UF4.2 | 0,1UF1.2 8.3,36.95 | IC1.1 15.05,42.8 14.8,42.8
  Top 0.406: 14.8,42.8 14,42.8
  Top 0.61: 14,42.8 11.7,40.5 11,40.5 10.5,40 10.5,36.95
  Top 0.813: NO_CONNECT.2 12.1,34.8 13.6,33.3 16.8,33.3 17.5,34 17.5,35.35 22,UF4.2
  Top 1.016: 22,UF3.2 22,UF4.2 | 8.3,36.95 10.5,36.95 NO_CONNECT.2
  Top 1.422: 22,UF3.2 28.4,37.6 31.8,41 L.2
  Top 2: L.2 31.8,52 38.6,58.8 62.9,58.8 72.6,49.1 VOUT_5V.MP
VOUT_5V1
  Top 0.305: 22,UF2.2 | 0,1UF6.2 8.3,8.25 | IC2.1 15.05,14.1 14.8,14.1
  Top 0.406: 14.8,14.1 14,14.1
  Top 0.61: 14,14.1 11.7,11.8 11,11.8 10.5,11.3 10.5,8.25
  Top 0.813: NO_CONNECT1.2 12.1,6.1 13.6,4.6 16.8,4.6 17.5,5.3 17.5,6.65 22,UF2.2
  Top 1.016: 22,UF1.2 22,UF2.2 | 8.3,8.25 10.5,8.25 NO_CONNECT1.2
  Top 1.422: 22,UF1.2 28.4,8.9 31.8,12.3 L1.2
  Top 2: L1.2 31.8,25.2 38.2,31.6 62.2,31.6 65.1,34.5 LSP7.MP
VOUT_5V2
  Top 0.305: 22,UF6.2 | 0,1UF9.2 44.3,8.25 | IC3.1 51.05,14.1 50.8,14.1
  Top 0.406: 50.8,14.1 50,14.1
  Top 0.61: 50,14.1 47.7,11.8 47,11.8 46.5,11.3 46.5,8.25
  Top 0.813: NO_CONNECT2.2 48.1,6.1 49.6,4.6 52.8,4.6 53.5,5.3 53.5,6.65 22,UF6.2
  Top 1.016: 22,UF5.2 22,UF6.2 | 44.3,8.25 46.5,8.25 NO_CONNECT2.2
  Top 1.422: 22,UF5.2 64.4,8.9 67.8,12.3 L2.2
  Top 2: L2.2 71.9,16.1 75.8,20 LSP9.MP
VOUT_5V3
  Top 0.305: 22,UF8.2 | 0,1UF12.2 44.3,36.95 | IC4.1 51.05,42.8 50.8,42.8
  Top 0.406: 50.8,42.8 50,42.8
  Top 0.61: 50,42.8 47.7,40.5 47,40.5 46.5,40 46.5,36.95
  Top 0.813: NO_CONNECT3.2 48.1,34.8 49.6,33.3 52.8,33.3 53.5,34 53.5,35.35 22,UF8.2
  Top 1.016: 22,UF7.2 22,UF8.2 | 44.3,36.95 46.5,36.95 NO_CONNECT3.2
  Top 1.422: 22,UF7.2 64.4,37.6 67.8,41 L3.2
  Top 2: L3.2 67.9,44.8 70.9,41.8 VOUT_5V3.MP

### Text on the board
tNames: POWER | 4×5V/8A OUT | IN 12_V | VOUT_5V | VOUT_5V3 | - | 1 | + | - | 2 | + | - | 3 | + | - | 4 | + | VOUT_5V1 | VOUT_5V2 | DESIGNED BY CYPRESS-ELECTRONICS | SPAIN | REV_1.3